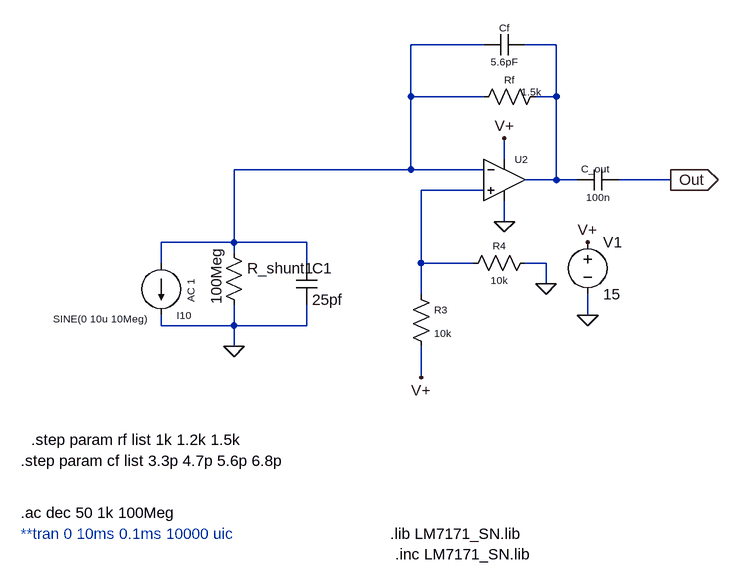
[diagram p0: schematic Receptor_LM7171.asc]
Receptor_LM7171.asc, the LTspice schematic file:
Version 4.1
SHEET 1 1892 1072
WIRE 192 16 80 16
WIRE 304 16 256 16
WIRE 80 96 80 16
WIRE 192 96 80 96
WIRE 304 96 304 16
WIRE 304 96 272 96
WIRE 224 192 224 160
WIRE 80 208 80 96
WIRE 80 208 -192 208
WIRE 192 208 80 208
WIRE 304 224 304 96
WIRE 304 224 256 224
WIRE 336 224 304 224
WIRE 480 224 400 224
WIRE 192 240 96 240
WIRE 224 288 224 256
WIRE -192 320 -192 208
WIRE -192 320 -304 320
WIRE -80 320 -192 320
WIRE -192 336 -192 320
WIRE -304 352 -304 320
WIRE -80 352 -80 320
WIRE 96 352 96 240
WIRE 176 352 96 352
WIRE 288 352 256 352
WIRE 288 384 288 352
WIRE 96 400 96 352
WIRE 352 432 352 400
WIRE -304 448 -304 432
WIRE -192 448 -192 416
WIRE -192 448 -304 448
WIRE -80 448 -80 416
WIRE -80 448 -192 448
WIRE -192 480 -192 448
WIRE 96 528 96 480
FLAG 352 432 0
FLAG 352 320 V+
FLAG 224 160 V+
FLAG 288 384 0
FLAG 96 528 V+
FLAG 224 288 0
FLAG 480 224 Out
IOPIN 480 224 Out
FLAG -192 480 0
SYMBOL cap 256 0 R90
WINDOW 0 0 32 VBottom 1
WINDOW 3 32 32 VTop 1
SYMATTR InstName Cf
SYMATTR Value 5.6pF
SYMBOL res 288 80 R90
WINDOW 0 0 56 VBottom 1
WINDOW 3 -2 23 VTop 1
SYMATTR InstName Rf
SYMATTR Value 1.5k
SYMBOL voltage 352 304 R0
WINDOW 123 0 0 Left 0
WINDOW 39 0 0 Left 0
SYMATTR InstName V1
SYMATTR Value 15
SYMBOL cap 400 208 R90
WINDOW 0 9 36 VBottom 1
WINDOW 3 32 32 VTop 1
SYMATTR InstName C_out
SYMATTR Value 100n
SYMBOL res 80 384 R0
WINDOW 0 36 40 Left 1
WINDOW 3 36 76 Left 1
SYMATTR InstName R3
SYMATTR Value 10k
SYMBOL res 272 336 R90
WINDOW 0 0 56 VBottom 1
WINDOW 3 32 56 VTop 1
SYMATTR InstName R4
SYMATTR Value 10k
SYMBOL OpAmps\\opamp2 224 160 R0
WINDOW 0 16 32 Left 1
SYMATTR InstName U2
SYMATTR Value ""
SYMATTR SpiceModel LM7171_SN
SYMBOL current -304 352 R0
WINDOW 0 24 80 Left 1
WINDOW 3 -95 96 Bottom 1
WINDOW 123 46 60 VLeft 1
WINDOW 39 0 0 Left 0
SYMATTR InstName I10
SYMATTR Value SINE(0 10u 10Meg)
SYMATTR Value2 AC 1
SYMBOL cap -96 352 R0
SYMATTR InstName C1
SYMATTR Value 25pf
SYMBOL res -208 320 R0
WINDOW 3 -11 95 VLeft 2
SYMATTR Value 100Meg
SYMATTR InstName R_shunt1
TEXT 48 768 Left 2 !.lib LM7171_SN.lib
TEXT 56 800 Left 2 !.inc LM7171_SN.lib
TEXT -520 736 Left 2 !.ac dec 50 1k 100Meg
TEXT -520 768 Left 2 ;**tran 0 10ms 0.1ms 10000 uic
TEXT -520 656 Left 2 !.step param cf list 3.3p 4.7p 5.6p 6.8p
TEXT -504 624 Left 2 !.step param rf list 1k 1.2k 1.5k

The netlist it stands for:
* Receptor_LM7171.asc
Cf N002 N001 5.6pF
Rf N002 N001 1.5k
V1 V+ 0 15
C_out Out N002 100n
R3 N003 V+ 10k
R4 0 N003 10k
X§U2 N003 N001 V+ 0 N002 LM7171_SN  ; pins In+ In- V+ V- OUT
I10 N001 0 SINE(0 10u 10Meg) AC 1
C1 N001 0 25pf
R_shunt1 N001 0 100Meg
.lib LM7171_SN.lib
.inc LM7171_SN.lib
.ac dec 50 1k 100Meg
* **tran 0 10ms 0.1ms 10000 uic
.step param cf list 3.3p 4.7p 5.6p 6.8p
.step param rf list 1k 1.2k 1.5k
.backanno
.end